# Altium schematic sheet Control_Indicator.SchDoc
size A4; DocumentNumber: 5; SheetNumber: 5; SheetTotal: 6
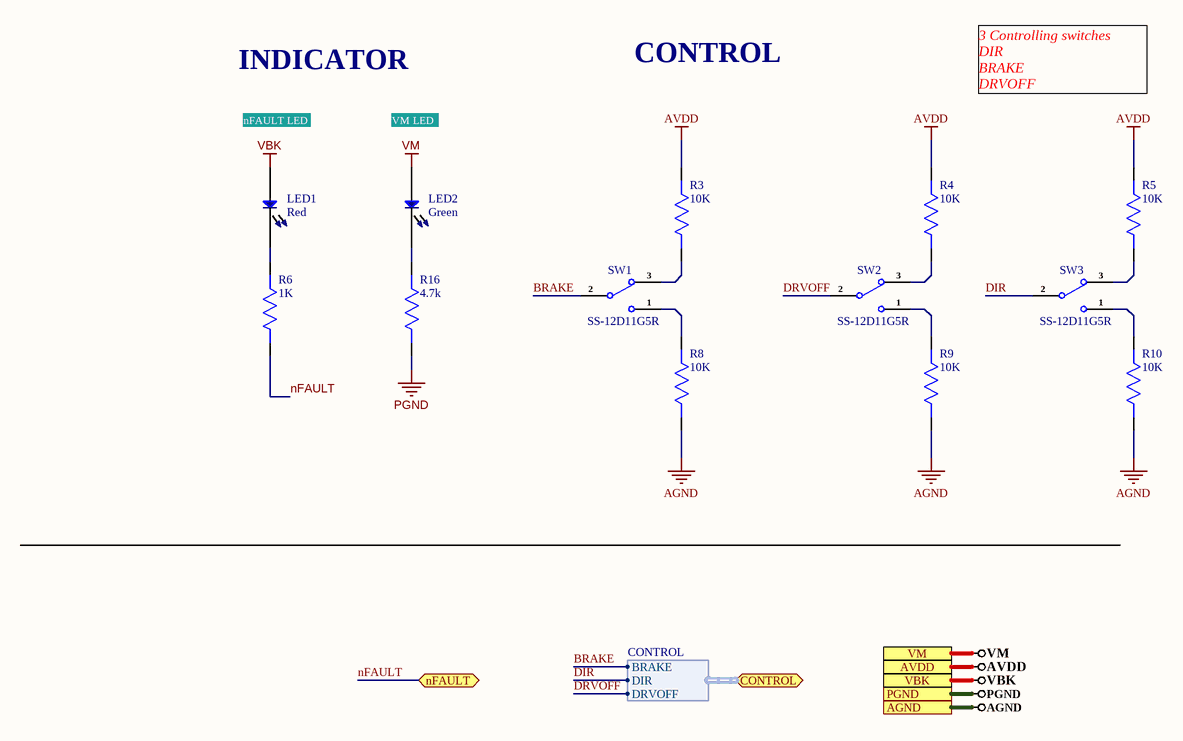
[diagram p0: Control_Indicator.SchDoc]

## Parts
LED1  Red  [LED 0402]
LED2  Green  [LED-0402]
R3  10K  [Res-0603]
R4  10K  [Res-0603]
R5  10K  [Res-0603]
R6  1K  [Res0402]
R8  10K  [Res-0603]
R9  10K  [Res-0603]
R10  10K  [Res-0603]
R16  4.7k  [RES-0805]
SW1  SS-12D11G5R  [SS-12D11G5R_]
SW2  SS-12D11G5R  [SS-12D11G5R_]
SW3  SS-12D11G5R  [SS-12D11G5R_]

## Ports
AGND, AVDD, CONTROL (bidir, harness CONTROL), nFAULT (bidir), PGND, VBK, VM

## Harnesses
CONTROL: BRAKE, DIR, DRVOFF

## Nets
AGND: R8.2 R9.2 R10.2 ; port AGND
AVDD: R3.1 R4.1 R5.1 ; port AVDD
PGND: R16.2 ; port PGND
VBK: LED1.1 ; port VBK
VM: LED2.1 ; port VM
BRAKE: SW1.2 ; port CONTROL.BRAKE
DIR: SW3.2 ; port CONTROL.DIR
DRVOFF: SW2.2 ; port CONTROL.DRVOFF
nFAULT: R6.2 ; port nFAULT
NetLED1_2: LED1.2 R6.1
NetLED2_2: LED2.2 R16.1
NetR3_2: R3.2 SW1.3
NetR4_2: R4.2 SW2.3
NetR5_2: R5.2 SW3.3
NetR8_1: R8.1 SW1.1
NetR9_1: R9.1 SW2.1
NetR10_1: R10.1 SW3.1

## Notes on the sheet
- INDICATOR
- CONTROL
- 3 Controlling switches
  DIR
  BRAKE
  DRVOFF
- nFAULT LED
- VM LED
- File:
- Title:
- Date:
- Page
- Num:
- Total:
- Drawn By: Huzaifa Ali

## Library data of the parts
LED1 = LTST-C281KRKT: Standard LEDs - SMD SMD LED Red 631nm 54mcd 130VA; Manufacturer: Vishay Lite-On; Lens Color: Colorless; Lens Style: Diffused,Colorless,Rectangular,Clear; Viewing Angle: 130°; Forward Current: 20mA; Forward Voltage: 2V; Lens Transparency: Clear; Number of Elements: 1; Power Dissipation: 62.5mW; Reverse Voltage: 5V; Supplier 1: Mouser; Manufacturer Part Number: LTST-C281KRKT; Stock 1: 2790; Pricing 1: 1=0.45, 10=0.25, 100=0.114, 1000=0.082, 3000=0.064, 9000=0.057 (USD); Mount: Surface Mount; Case/Package: 0402; Number of Pins: 2; Color: Red; Case Code (Metric): 1005; Case Code (Imperial): 0402; Min Operating Temperature: -30°C; Max Operating Temperature: 85°C; Package Quantity: 3000; Illumination Color: Red; Luminous Intensity: 54mcd; Packaging: Tape and Reel; Test Current: 20mA; Dominant Wavelength: 631nm; Number of LEDs: 1; Length: 1mm; Height: 0.35mm; Width: 0.5mm; Depth: 0.5mm; Lead Free: Lead Free; ComponentLink1URL: http://optoelectronics.liteon.com/ja-jp/api/DwonloadFileHandler.ashx?txtSpecNo=DS22-2008-0117&txtPartNo=LTST-C281KRKT&src-supplier=Avnet; ComponentLink1Description: http://optoelectronics.liteon.com/ja-jp/api/DwonloadFileHandler.ashx?txtSpecNo=DS22-2008-0117&txtPartNo=LTST-C281KRKT&src-supplier=Avnet; ComponentLink2URL: http://components.arrow.com/part/dataview/52218614S9812790N1331?src-supplier=Arrow; ComponentLink2Description: http://components.arrow.com/part/dataview/52218614S9812790N1331?src-supplier=Arrow; ComponentLink3URL: http://www.mouser.com/ds/2/239/LTST-C281KRKT-1141717.pdf?src-supplier=Mouser; ComponentLink3Description: http://www.mouser.com/ds/2/239/LTST-C281KRKT-1141717.pdf?src-supplier=Mouser; ComponentLink4URL: http://optoelectronics.liteon.com/upload/download/DS22-2008-0117/P_100_LTST-C281KRKT.pdf?src-supplier=Future+Electronics; ComponentLink4Description: http://optoelectronics.liteon.com/upload/download/DS22-2008-0117/P_100_LTST-C281KRKT.pdf?src-supplier=Future+Electronics; ComponentLink5URL: http://optoelectronics.liteon.com/upload/download/DS22-2008-0117/LTST-C281KRKT.pdf?src-supplier=Digi-Key; ComponentLink5Description: http://optoelectronics.liteon.com/upload/download/DS22-2008-0117/LTST-C281KRKT.pdf?src-supplier=Digi-Key; Supplier Part Number 1: 859-LTST-C281KRKT
LED2 = 16-213/GHC-YR1S1/3T: Green 520~535nm 0402 Light Emitting Diodes (LED) RoHS; Manufacturer: Everlight Elec; Luminous Intensity (IF=20mA): 112~285mcd; Package: 0402; Illumination Color: Green; Dominant Wavelength / Coordinate rank: 520~535nm; Mounting Type: Surface Mount; Manufacturer Part Number: 16-213/GHC-YR1S1/3T; ComponentLink1Description: LCSC; ComponentLink1URL: https://www.lcsc.com/product-detail/Light-Emitting-Diodes-LED_Everlight-Elec-16-213-GHC-YR1S1-3T_C74338.html; LCSC Part Number: C74338
R3-R5 R8-R10 = AC0603JR-0710KL: RES SMD 10K OHM 5% 1/10W 0603; Manufacturer: Yageo; Voltage Rating: 50V; Resistance: 10kR; Power Rating: 100mW; Temperature Coefficient: 100ppm/°C; Supplier 1: Future Electronics; Manufacturer Part Number: AC0603JR-0710KL; RoHS: Yes; Category: Chip SMD Resistors; Stock 1: 1533000; Pricing 1: 5000=0.00540 (USD); Case/Package: 0603; Case Code (Imperial): 0603; Case Code (Metric): 1608; Size Code: 0603; Min Operating Temperature: -55°C; Max Operating Temperature: 155°C; Packaging: Tape and Reel; Tolerance: 5%; Package Quantity: 1; Resistor Type: Thick Film; Termination: SMD/SMT; Number of Terminations: 2; Max Power Dissipation: 100mW; Features: Moisture Resistant,Automotive AEC-Q200,Anti-Sulfur; Series: AC; Construction: Rectangular; Length: 0.063inch; Width: 0.031inch; Height: 0.022inch; Depth: 0.8mm; Military Standard: Not; Lead Free: Lead Free; RoHS Compliant: Yes; ComponentLink1URL: https://datasheet.ciiva.com/5562/pyu-ac-51-rohs-l-2-5562553.pdf?src-supplier=Mouser; ComponentLink1Description: https://datasheet.ciiva.com/5562/pyu-ac-51-rohs-l-2-5562553.pdf?src-supplier=Mouser; Supplier Part Number 1: 1029044; LCSC Part Number: C140867
R6 = ERJ-2GEJ102X: RES SMD 1K OHM 5% 1/10W 0402; Manufacturer: Panasonic; Resistance: 1kR; Temperature Coefficient: 200ppm/°C; Voltage Rating: 50V; Power Rating: 100mW; Supplier 1: Digi-Key; Manufacturer Part Number: ERJ-2GEJ102X; Stock 1: 3855795; Pricing 1: 1=0.1, 10=0.032, 100=0.0129, 1000=0.00578, 2500=0.00502, 5000=0.00414 (USD); Mount: Surface Mount; Case/Package: 0402; Contact Plating: Tin; Case Code (Metric): 1005; Case Code (Imperial): 0402; Min Operating Temperature: -55°C; Max Operating Temperature: 155°C; Tolerance: 5%; Composition: Thick Film; Packaging: Tape and Reel; Package Quantity: 1; Number of Terminations: 2; Termination: SMD/SMT; Military Standard: Not; Max Power Dissipation: 100mW; Voltage Rating (DC): 50V; Features: Automotive AEC-Q200; Working Voltage: 50V; Length: 1mm; Height: 0.35mm; Width: 0.02inch; Depth: 0.5mm; Radiation Hardening: No; REACH SVHC: No SVHC; Lead Free: Lead Free; ComponentLink1URL: https://industrial.panasonic.com/cdbs/www-data/pdf/RDA0000/AOA0000C301.pdf?src-supplier=Future+Electronics; ComponentLink1Description: https://industrial.panasonic.com/cdbs/www-data/pdf/RDA0000/AOA0000C301.pdf?src-supplier=Future+Electronics; ComponentLink2URL: http://www.jameco.com/Jameco/Products/ProdDS/1986781.pdf?src-supplier=Jameco; ComponentLink2Description: http://www.jameco.com/Jameco/Products/ProdDS/1986781.pdf?src-supplier=Jameco; ComponentLink3URL: http://www.farnell.com/datasheets/2059623.pdf?src-supplier=Farnell; ComponentLink3Description: http://www.farnell.com/datasheets/2059623.pdf?src-supplier=Farnell; ComponentLink4URL: http://industrial.panasonic.com/www-data/pdf/AOA0000/AOA0000CE1.pdf?src-supplier=Avnet; ComponentLink4Description: http://industrial.panasonic.com/www-data/pdf/AOA0000/AOA0000CE1.pdf?src-supplier=Avnet; ComponentLink5URL: http://www.alliedelec.com/m/d/51cd0790071e1666bdb9d00c57fcf960.pdf?src-supplier=Allied+Electronics; ComponentLink5Description: http://www.alliedelec.com/m/d/51cd0790071e1666bdb9d00c57fcf960.pdf?src-supplier=Allied+Electronics; ComponentLink6URL: http://industrial.panasonic.com/www-data/pdf/AOA0000/AOA0000CE1.pdf?src-supplier=Avnet+Europe; ComponentLink6Description: http://industrial.panasonic.com/www-data/pdf/AOA0000/AOA0000CE1.pdf?src-supplier=Avnet+Europe; ComponentLink7URL: http://www.farnell.com/datasheets/2059623.pdf?src-supplier=Element14; ComponentLink7Description: http://www.farnell.com/datasheets/2059623.pdf?src-supplier=Element14; ComponentLink8URL: http://industrial.panasonic.com/cdbs/www-data/pdf/RDA0000/AOA0000C301.pdf?src-supplier=Farnell; ComponentLink8Description: http://industrial.panasonic.com/cdbs/www-data/pdf/RDA0000/AOA0000C301.pdf?src-supplier=Farnell; ComponentLink9URL: http://industrial.panasonic.com/www-data/pdf/AOA0000/AOA0000CE1.pdf?src-supplier=Avnet+Asia; ComponentLink9Description: http://industrial.panasonic.com/www-data/pdf/AOA0000/AOA0000CE1.pdf?src-supplier=Avnet+Asia; Supplier Part Number 1: P1.0KJCT-ND
R16 = CRCW08054K70FKEAHP: Res Thick Film 0805 4.7K Ohm 1% 0.5W ±100ppm/°C Molded SMD SMD Paper T/R; Manufacturer: Vishay; Power Rating: 330mW; Voltage Rating: 150V; Resistance: 4.7kR; Max Power Dissipation: 500mW; Item Type: Resistor; Supplier 1: RSComponents; Manufacturer Part Number: CRCW08054K70FKEAHP; RoHS: Yes; Category: Chip SMD Resistors; Stock 1: 8150; Pricing 1: 100=0.15700, 250=0.14600, 500=0.13600, 1000=0.12500 (GBP); Mount: Surface Mount; Case/Package: 0805; Weight: 0.000194oz; Case Code (Imperial): 0805; Case Code (Metric): 2012; Contact Plating: Tin; Min Operating Temperature: -55°C; Max Operating Temperature: 155°C; Tolerance: 1%; Packaging: Tape and Reel; Package Quantity: 5000; Resistor Type: Thick Film; Termination: SMD/SMT; Temperature Coefficient: 100ppm/°C; Voltage Rating (DC): 150V; Features: Automotive AEC-Q200; Series: CRCW-HP; Number of Terminations: 2; Resistance Tolerance: 1%; Construction: Rectangular; Technology: THICK FILM; Length: 2mm; Width: 1.2mm; Height: 0.5mm; Depth: 1.25mm; Ratings: AEC-Q200; Radiation Hardening: No; Military Standard: Not; Lead Free: Lead Free; RoHS Compliant: Yes; ComponentLink1URL: https://datasheet.ciiva.com/8079/424479-8079653.pdf?src-supplier=Element14; ComponentLink1Description: https://datasheet.ciiva.com/8079/424479-8079653.pdf?src-supplier=Element14; ComponentLink2URL: https://datasheet.ciiva.com/9072/crcwhpe3-9072073.pdf?src-supplier=Avnet; ComponentLink2Description: https://datasheet.ciiva.com/9072/crcwhpe3-9072073.pdf?src-supplier=Avnet; LCSC Part Number: C313926; Supplier Part Number 1: 8123574P
SW1-SW3 = SS-12D11G5R: Shrouded 5A SPDT 125V 6.3mm 13.5mm 125V 6.6mm 5A PCPin 10000 Rectangular columnar -40℃~+85℃ Black Plugin Slide Switches ROHS; Manufacturer: XKB Connectivity; Manufacturer Part Number: SS-12D11G5R; Package: Custom; LCSC Part Number: C388633; ComponentLink1Description: LCSC; ComponentLink1URL: https://www.lcsc.com/product-detail/Slide-Switches_XKB-Connectivity-SS-12D11G5R_C388633.html